# Altium project AlarmClock.PrjPcb
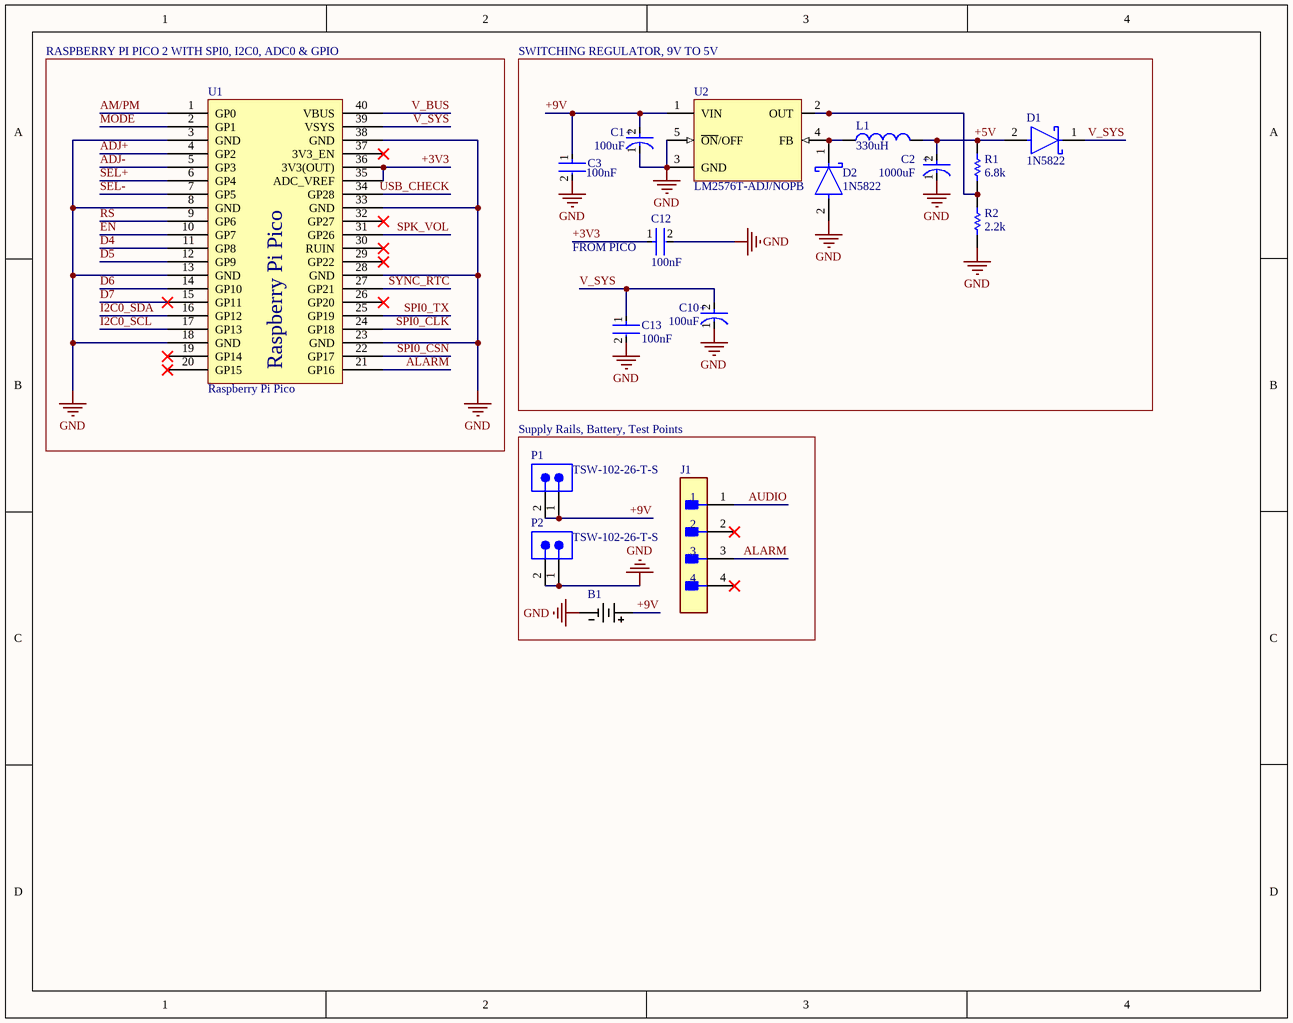
[diagram p0: Core.SchDoc]
3 sheets, 55 parts. Net scope: global (net labels, ports and power ports of the same name join across sheets).
Board file: AlarmClock.PcbDoc
Sheets:
  Core.SchDoc
  Control & Inputs.SchDoc
  Peripherals.SchDoc

## Sheet Core.SchDoc
size A; SheetNumber: 1; SheetTotal: 3

### Parts
B1  BC9VPC  [BC9VPC_MPD]  (value not drawn)
C1  Capacitance: 100uF  [FP-RAD-TH-D_6_3_0_5-L_11-MFG]  (hidden comment: EEUFM1E101B)
C2  value 1000uF  [FP-RAD-TH-D_12_5_0_5-L_20-MFG]  (hidden comment: EEUFP1V102B)
C3  Capacitance: 100nF  [FP-RDE3M1-MFG]  (hidden comment: RDED72W104K3K1H03B)
C10  Capacitance: 100uF  [FP-RAD-TH-D_6_3_0_5-L_11-MFG]  (hidden comment: EEUFM1E101B)
C12  Capacitance: 100nF  [FP-RDE3M1-MFG]  (hidden comment: RDED72W104K3K1H03B)
C13  Capacitance: 100nF  [FP-RDE3M1-MFG]  (hidden comment: RDED72W104K3K1H03B)
D1  1N5822  [FP-DO-201AD-MFG]
D2  1N5822  [FP-DO-201AD-MFG]
J1  TSW-104-23-T-S  [FP-TSW-104-23-T-S-MFG]  (value not drawn)
L1  value 330uH  [SPD73R-334M]  (hidden comment: Inductor)
P1  TSW-102-26-T-S  [SMTC-TSW-102-26-XX-S]
P2  TSW-102-26-T-S  [SMTC-TSW-102-26-XX-S]
R1  Resistance: 6.8k  [RESA60-630X240]  (hidden comment: MFR-25FBF52-1M)
R2  Resistance: 2.2k  [RESA60-630X240]  (hidden comment: MFR-25FBF52-1M)
U1  Raspberry Pi Pico  [Raspberry Pi Pico]
U2  LM2576T-ADJ/NOPB  [KC0005A]

### Blocks framed on the sheet
RASPBERRY PI PICO 2 WITH SPI0, I2C0, ADC0 & GPIO: U1
Supply Rails, Battery, Test Points: B1 J1 P1 P2

### Nets
+3V3: C12.1 U1.35(ADC_VREF) U1.36(3V3(OUT))
+5V: C2.2(A) D1.2(A) L1.2 R1.2
GND: B1.2 C1.1(C) C2.1(C) C3.2 C10.1(C) C12.2 C13.2 D2.2(A) P2.1 P2.2 R2.1 U1.3(GND) U1.8(GND) U1.13(GND) U1.18(GND) U1.23(GND) U1.28(GND) U1.33(GND) U1.38(GND) U2.3(GND) U2.5(~{ON}/OFF)
+9V: B1.1 C1.2(A) C3.1 P1.1 P1.2 U2.1(VIN)
ADJ+: U1.4(GP2)
ADJ-: U1.5(GP3)
ALARM: J1.3 U1.21(GP16)
AM/PM: U1.1(GP0)
AUDIO: J1.1
D4: U1.11(GP8)
D5: U1.12(GP9)
D6: U1.14(GP10)
D7: U1.15(GP11)
EN: U1.10(GP7)
I2C0_SCL: U1.17(GP13)
I2C0_SDA: U1.16(GP12)
MODE: U1.2(GP1)
RS: U1.9(GP6)
SEL+: U1.6(GP4)
SEL-: U1.7(GP5)
SPI0_CLK: U1.24(GP18)
SPI0_CSN: U1.22(GP17)
SPI0_TX: U1.25(GP19)
SPK_VOL: U1.31(GP26)
SYNC_RTC: U1.27(GP21)
USB_CHECK: U1.34(GP28)
V_BUS: U1.40(VBUS)
V_SYS: C10.2(A) C13.1 D1.1(C) U1.39(VSYS)
NetD2_1: D2.1(C) L1.1 U2.4(FB)
NetR1_1: R1.1 R2.2 U2.2(OUT)

Not connected (* = marked no-connect by the designer): J1 2* 4*; U1 19(GP14)* 20(GP15)* 26(GP20)* 29(GP22)* 30(RUIN)* 32(GP27)* 37(3V3_EN)*

### Notes on the sheet
- SWITCHING REGULATOR, 9V TO 5V
- (near C12) FROM PICO
- (in symbol CMP-05427-000856-1) +
- (in symbol CMP-05427-001378-1) +

### Library data of the parts
B1 = BC9VPC: Description; Manufacturer_Name: Memory Protection Devices; Copyright: Copyright (C) 2026 Ultra Librarian. All rights reserved.; Manufacturer_Part_Number: BC9VPC
C1 C10 = CMP-05427-000856-1: Aluminum Electrolytic Capacitors (Radial Lead Type) 100uF ±20% 25V; Lead Diameter: 0.5mm; Polarity: Polar; Ripple Current: 455mA; Impedance: 130mR; Life (Hours): 2000Hour; Length: 11mm; Min Operating Temperature: -40°C; Termination: Radial; Diameter: 6mm; Lead Pitch: 5mm; Tolerance: 20%; Case/Package: Radial; Voltage Rating (DC): 25V; Height - Seated (Max): 0.5inch; RoHS Compliant: Yes; Series: FM; Package Quantity: 2000; Voltage Rating: 25V; Max Operating Temperature: 105°C; Mount: Through Hole; ESR (Equivalent Series Resistance): 130mR; Packaging: Tape and Reel
C2 = CMP-05427-001378-1: Aluminum Electrolytic Capacitors (Radial Lead Type) AEC-Q200 Qualified 1000uF ±20% 35V; RoHS Compliant: Yes
C3 C12 C13 = CMP-06035-016817-1: Ceramic Capacitor 100nF ±10% 450V X7T Radial; Tolerance: 10%; Voltage Rating: 450V; Lead Pitch: 5mm; Max Operating Temperature: 125°C; Voltage Rating (DC): 450V; Case/Package: Radial; Dielectric: X7T; Min Operating Temperature: -55°C; REACH SVHC: No SVHC
D1 D2 = CMP-12187-000025-1: DIODE SCHOTTKY 40V 3A DO201AD; Manufacturer: STMicroelectronics; Max Junction Temp: +150°C; Peak Reverse Current: 2mA; Max Surge Forward Current: 80A; Temperature Range High: +150°C; Automotive: No; RoHS: TRUE; ComponentLink2Description: Datasheet; Manufacturer Part Number: 1N5822; Lead Free: Yes; Octopart: https://octopart.com/1n5822-stmicroelectronics-323225; Device Class L2: Diodes; Max Repetitive Reverse Voltage: 40V; Temperature: to +150°C; Height: 5.3mm; Category: Diode; Digikey Description: DIODE SCHOTTKY 40V 3A DO201AD; ComponentLink2URL: https://www.st.com/resource/en/datasheet/1n5822.pdf; Device Class L3: Schottky Diodes; Device Class L1: Discrete Semiconductors; Forward Current: 3A; Mouser Description: Schottky Diodes & Rectifiers Vr/40V Io/3A BULK; Package: DO-201AD
J1 = CMP-02766-001388-1: CONN HEADER VERT 4POS 2.54MM; Number of Contacts: 4; Gender: Male; Connector Type: Male Pin; Max Voltage Rating (AC): 550V; Max Current Rating: 7.6A; Radiation Hardening: No; Lead Free: Lead Free; RoHS Compliant: Yes; Contact Material: Bronze; Number of Positions: 4; Housing Color: Black; Min Operating Temperature: -55°C; Mount: Through Hole; Number of Rows: 1; Orientation: Straight; Contact Mating Length: 0.23inch; Contact Type: Male Pin; REACH SVHC: No SVHC; Max Operating Temperature: 105°C; Color: Black; Pitch: 2.54mm; Length: 10.16mm; Series: TSW; Packaging: Bulk; Contact Plating: Tin; Package Quantity: 1; Termination: Solder; Housing Material: Polyester; Width: 2.54mm; Depth: 2.54mm
L1 = Inductor: Code_IEC: 1005; Published: 8-Jun-2000; LatestRevisionDate: 29-May-2009; LatestRevisionNote: IPC-7351 Footprint Added.; PackageReference: 0402-A; Publisher: Altium Limited; PackageDescription: Chip Inductor; Code_JEITA: 0402
P1 P2 = CMP-1024-00328-1: 0.025" SQ Post Header, Through-hole, Vertical, -55 to 105 degC, 2.54 mm Pitch, 2-Pin, Male, RoHS; Manufacturer: Samtec; Pitch: 2.54 mm; PackageReference: TSW-102-26-XX-S; ComponentLink1URL: http://www.samtec.com; ComponentLink3Description: Package Specification; ComponentLink3URL: http://www.samtec.com/documents/webfiles/cpdf/TSW-XXX-XX-XXX-X-XX-XXX-MKT.pdf; DatasheetVersion: F-214; ComponentLink2URL: http://www.samtec.com/documents/webfiles/pdf/TSW_TH.PDF; Mounting Technology: Through-hole; ComponentLink2Description: Datasheet; PartNumber: TSW-102-26-T-S; ComponentLink1Description: Manufacturer URL; PackageDescription: .025[0.64] SQ. Post Terminal Strip Assembly; Orientation: Vertical; PackageVersion: DM, 8/1988; Temperature Range: -55 to 105 degC; RoHS: True
R1 R2 = CMP-1659-00070-1: Axial Resistor, 1 MOhm, +/- 1%, 250 mW, -55 to 155 degC, 2-Pin THD, RoHS, Bulk; Power Rating: 250 mW; Voltage Rating: 250 V; ComponentLink1Description: Manufacturer URL; PackageReference: MFR-25; ComponentLink2Description: Datasheet; ComponentLink2URL: http://www.yageo.com/documents/recent/Yageo%20LR_MFR_2013.pdf; Tolerance: 1%; DatasheetVersion: Apr-13; Package Quantity: 200; Packaging: Bulk; Case\Package: Axial; RoHSCompliant: true; ComponentLink1URL: http://www.yageo.com/; Length: 0.248 inch; Min Operating Temperature: -55 degC; Mount: Through Hole; PackageDescription: 2-Pin Axial Lead, Dia 2.4 mm, Body Length 6.3 mm; Max Operating Temperature: 155 degC
U2 = CMP-0069-02005-3: SIMPLE SWITCHER® 3A Step-Down Voltage Regulator, 5-pin TO-220, Pb-Free; Manufacturer: Texas Instruments; PowerWise: N; PackageTopMarking: NSUZXYTTE#*LM2576T*-ADJ P+; CompType: Switcher; PinCount: 5; PackageReference: KC0005A; RoHS: Y; Code_JEDEC: TO-220-AB; ComponentLink1URL: http://www.ti.com/general/docs/lit/getliterature.tsp?genericPartNumber=LM2576&fileType=pdf; ComponentLink1Description: Datasheet URL; PackageDescription: TO-220, Molded, 5 Lead, Straight

## Sheet Control & Inputs.SchDoc
size A; SheetNumber: 2; SheetTotal: 3
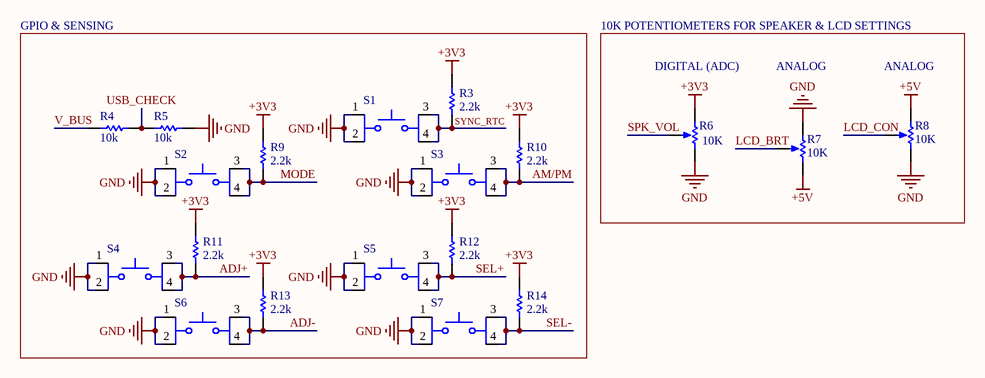
[diagram p1: Control & Inputs.SchDoc]

### Parts
R3  Resistance: 2.2k  [RESA60-630X240]  (hidden comment: MFR-25FBF52-1M)
R4  Resistance: 10k  [RESA60-630X240]  (hidden comment: MFR-25FBF52-1M)
R5  Resistance: 10k  [RESA60-630X240]  (hidden comment: MFR-25FBF52-1M)
R6  value 10K  [POT OFFSET 200]  (hidden comment: RPot_3)
R7  value 10K  [POT OFFSET 200]  (hidden comment: RPot_3)
R8  value 10K  [POT OFFSET 200]  (hidden comment: RPot_3)
R9  Resistance: 2.2k  [RESA60-630X240]  (hidden comment: MFR-25FBF52-1M)
R10  Resistance: 2.2k  [RESA60-630X240]  (hidden comment: MFR-25FBF52-1M)
R11  Resistance: 2.2k  [RESA60-630X240]  (hidden comment: MFR-25FBF52-1M)
R12  Resistance: 2.2k  [RESA60-630X240]  (hidden comment: MFR-25FBF52-1M)
R13  Resistance: 2.2k  [RESA60-630X240]  (hidden comment: MFR-25FBF52-1M)
R14  Resistance: 2.2k  [RESA60-630X240]  (hidden comment: MFR-25FBF52-1M)
S1  TL1105AF160Q  [SW_TL1105AF160Q]  (value not drawn)
S2  TL1105AF160Q  [SW_TL1105AF160Q]  (value not drawn)
S3  TL1105AF160Q  [SW_TL1105AF160Q]  (value not drawn)
S4  TL1105AF160Q  [SW_TL1105AF160Q]  (value not drawn)
S5  TL1105AF160Q  [SW_TL1105AF160Q]  (value not drawn)
S6  TL1105AF160Q  [SW_TL1105AF160Q]  (value not drawn)
S7  TL1105AF160Q  [SW_TL1105AF160Q]  (value not drawn)

### Blocks framed on the sheet
GPIO & SENSING: R3-R5 R9-R14 S1-S7

### Nets
+3V3: R3.2 R6.1(TOP) R9.2 R10.2 R11.2 R12.2 R13.2 R14.2
+5V: R7.3(BOT) R8.1(TOP)
GND: R5.2 R6.3(BOT) R7.1(TOP) R8.3(BOT) S1.1 S1.2 S2.1 S2.2 S3.1 S3.2 S4.1 S4.2 S5.1 S5.2 S6.1 S6.2 S7.1 S7.2
ADJ+: R11.1 S4.3 S4.4
ADJ-: R13.1 S6.3 S6.4
AM/PM: R10.1 S3.3 S3.4
LCD_BRT: R7.2(TAP)
LCD_CON: R8.2(TAP)
MODE: R9.1 S2.3 S2.4
SEL+: R12.1 S5.3 S5.4
SEL-: R14.1 S7.3 S7.4
SPK_VOL: R6.2(TAP)
SYNC_RTC: R3.1 S1.3 S1.4
USB_CHECK: R4.2 R5.1
V_BUS: R4.1

### Notes on the sheet
- 10K POTENTIOMETERS FOR SPEAKER & LCD SETTINGS
- (near R6) DIGITAL (ADC)
- ANALOG
- (near R8) ANALOG

### Library data of the parts
R3-R5 R9-R14 = CMP-1659-00070-1: as R1 on sheet Core; ComponentLink1Description: Manufacturer URL; PackageReference: MFR-25; ComponentLink2Description: Datasheet; ComponentLink2URL: http://www.yageo.com/documents/recent/Yageo%20LR_MFR_2013.pdf; Tolerance: 1%; DatasheetVersion: Apr-13; Package Quantity: 200; Packaging: Bulk; Case\Package: Axial; RoHSCompliant: true; ComponentLink1URL: http://www.yageo.com/; Length: 0.248 inch; Min Operating Temperature: -55 degC; Mount: Through Hole; PackageDescription: 2-Pin Axial Lead, Dia 2.4 mm, Body Length 6.3 mm; Max Operating Temperature: 155 degC
R6-R8 = RPot: Potentiometer; Sim Note: Enter the Resistance value and the set point into parameter fields.; Set Position: 0.5; Published: 8-Jun-2000; LatestRevisionDate: 17-Jul-2002; LatestRevisionNote: Re-released for DXP Platform.; Publisher: Altium Limited
S1-S7 = TL1105AF160Q: Tactile Switch SPST-NO Top Actuated Through Hole; MF: E-Switch; SnapEDA_Link: https://www.snapeda.com/parts/TL1105AF160Q/E-Switch/view-part/?ref=snap; Package: None; Value: *; MP: TL1105AF160Q; Check_prices: https://www.snapeda.com/parts/TL1105AF160Q/E-Switch/view-part/?ref=eda

## Sheet Peripherals.SchDoc
size A; SheetNumber: 3; SheetTotal: 3
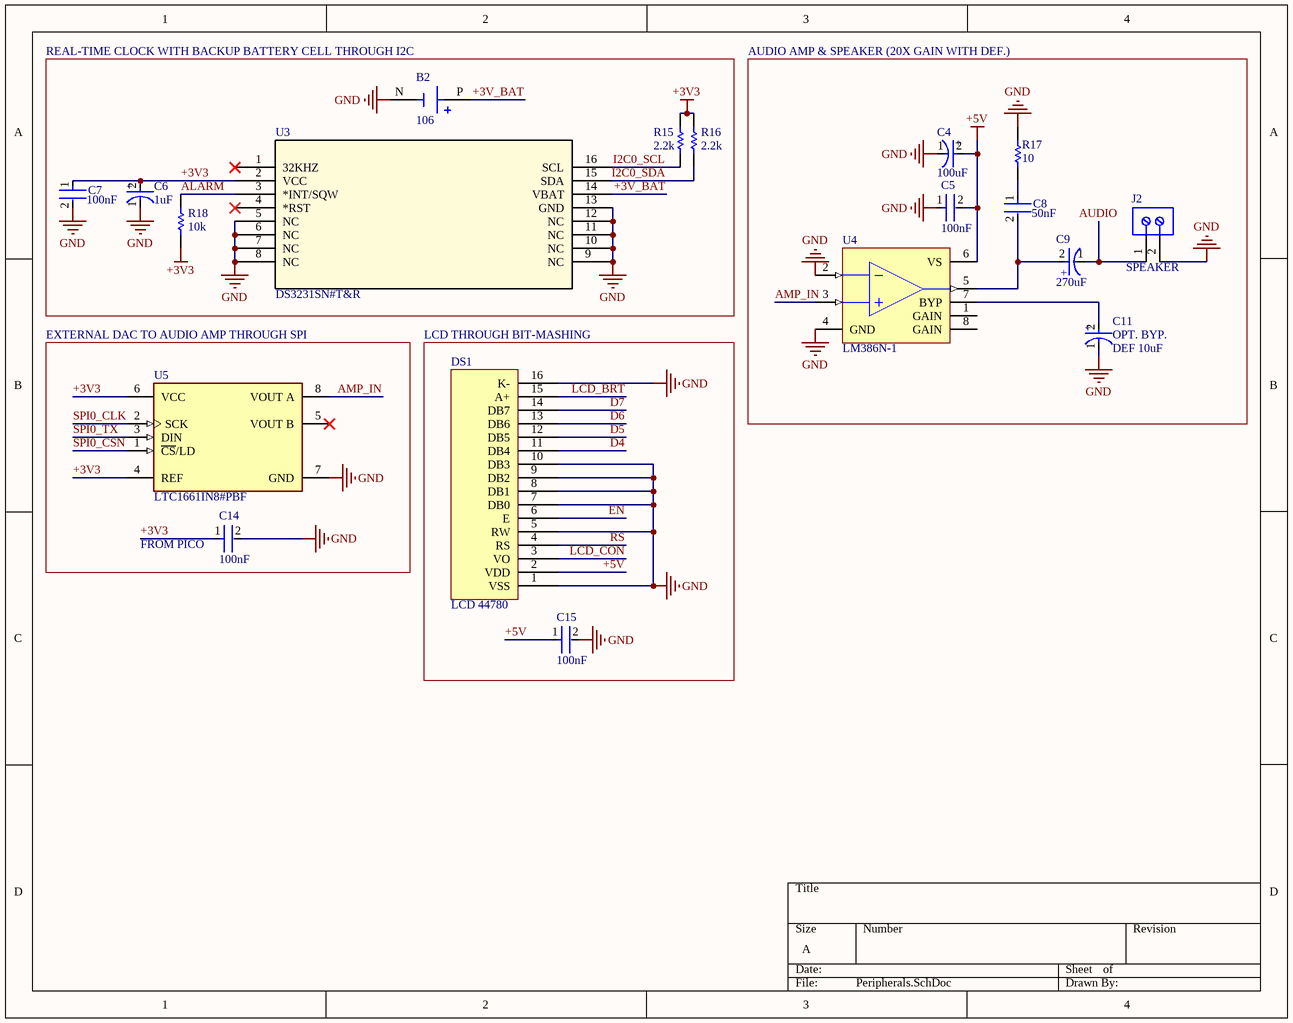
[diagram p2: Peripherals.SchDoc]

### Parts
B2  106  [BAT_106]
C4  Capacitance: 100uF  [FP-RAD-TH-D_6_3_0_5-L_11-MFG]  (hidden comment: EEUFM1E101B)
C5  Capacitance: 100nF  [FP-RDE3M1-MFG]  (hidden comment: RDED72W104K3K1H03B)
C6  Capacitance: 1uF  [FP-RAD-TH-D_6_3_0_5-L_11-MFG]  (hidden comment: EEUFM1E101B)
C7  Capacitance: 100nF  [FP-RDE3M1-MFG]  (hidden comment: RDED72W104K3K1H03B)
C8  Capacitance: 50nF  [FP-RDE3M1-MFG]  (hidden comment: RDED72W104K3K1H03B)
C9  Capacitor: 270uF  [FP-RAD-TH-D_12_5_0_5-L_20-MFG]  (hidden comment: EEUFS1K271B)
C11  Capacitance: OPT. BYP.  [FP-RAD-TH-D_6_3_0_5-L_11-MFG]  (hidden comment: EEUFM1E101B)
C14  Capacitance: 100nF  [FP-RDE3M1-MFG]  (hidden comment: RDED72W104K3K1H03B)
C15  Capacitance: 100nF  [FP-RDE3M1-MFG]  (hidden comment: RDED72W104K3K1H03B)
DS1  LCD 44780  [OLED 16x2]
J2  1714955  [PHOE-1714955_V]  (value not drawn)
R15  Resistance: 2.2k  [RESA60-630X240]  (hidden comment: MFR-25FBF52-1M)
R16  Resistance: 2.2k  [RESA60-630X240]  (hidden comment: MFR-25FBF52-1M)
R17  Resistance: 10  [RESA60-630X240]  (hidden comment: MFR-25FBF52-1M)
R18  Resistance: 10k  [RESA60-630X240]  (hidden comment: MFR-25FBF52-1M)
U3  DS3231SN#T&R  [21-0042B_16_MXM]
U4  LM386N-1  [DIP-8]
U5  LTC1661IN8#PBF  [FP-N-8-05-08-1510-MFG]

### Blocks framed on the sheet
REAL-TIME CLOCK WITH BACKUP BATTERY CELL THROUGH I2C: B2 C6 C7 R15 R16 R18 U3
LCD THROUGH BIT-MASHING: C15 DS1

### Nets
+3V3: C6.2(A) C7.1 C14.1 R15.2 R16.2 R18.1 U3.2(VCC) U5.4(REF) U5.6(VCC)
+5V: C4.2(A) C5.2 C15.1 DS1.2(VDD) U4.6(VS)
GND: B2.N(NEG) C4.1(C) C5.1 C6.1(C) C7.2 C11.1(C) C14.2 C15.2 DS1.1(VSS) DS1.5(RW) DS1.7(DB0) DS1.8(DB1) DS1.9(DB2) DS1.10(DB3) DS1.16(K-) J2.2 R17.1 U3.5(NC) U3.6(NC) U3.7(NC) U3.8(NC) U3.9(NC) U3.10(NC) U3.11(NC) U3.12(NC) U3.13(GND) U4.2(IN-) U4.4(GND) U5.7(GND)
+3V_BAT: B2.P(POS) U3.14(VBAT)
ALARM: R18.2 U3.3(*INT/SQW)
AMP_IN: U4.3(IN+) U5.8(VOUT_A)
AUDIO: C9.1(C) J2.1
D4: DS1.11(DB4)
D5: DS1.12(DB5)
D6: DS1.13(DB6)
D7: DS1.14(DB7)
EN: DS1.6(E)
I2C0_SCL: R15.1 U3.16(SCL)
I2C0_SDA: R16.1 U3.15(SDA)
LCD_BRT: DS1.15(A+)
LCD_CON: DS1.3(VO)
RS: DS1.4(RS)
SPI0_CLK: U5.2(SCK)
SPI0_CSN: U5.1(~{CS}/LD)
SPI0_TX: U5.3(DIN)
NetC8_1: C8.1 R17.2
NetC8_2: C8.2 C9.2(A) U4.5(OUT)
NetC11_2: C11.2(A) U4.7(BYP)

Not connected (* = marked no-connect by the designer): U3 1(32KHZ)* 4(*RST)*; U4 1(GAIN) 8(GAIN); U5 5(VOUT_B)*

### Notes on the sheet
- AUDIO AMP & SPEAKER (20X GAIN WITH DEF.)
- (near J2) SPEAKER
- EXTERNAL DAC TO AUDIO AMP THROUGH SPI
- (near C11) DEF 10uF
- (near C14) FROM PICO
- (in symbol CMP-05427-000433-1) +
- (in symbol CMP-05427-000856-1) +

### Library data of the parts
B2 = 106: Battery Holder, Heavy Duty, THM, Plastic, 1 Cell, 20mm | Keystone Electronics 106; SnapEDA_Link: https://www.snapeda.com/parts/106/Keystone/view-part/?ref=snap; Package: None; Value: *; MF: Keystone Electronics; MP: 106; Check_prices: https://www.snapeda.com/parts/106/Keystone/view-part/?ref=eda
C4 C6 C11 = CMP-05427-000856-1: as C1 on sheet Core; Length: 11mm; Min Operating Temperature: -40°C; Termination: Radial; Diameter: 6mm; Lead Pitch: 5mm; Tolerance: 20%; Case/Package: Radial; Voltage Rating (DC): 25V; Height - Seated (Max): 0.5inch; RoHS Compliant: Yes; Series: FM; Package Quantity: 2000; Voltage Rating: 25V; Max Operating Temperature: 105°C; Mount: Through Hole; ESR (Equivalent Series Resistance): 130mR; Packaging: Tape and Reel
C5 C7 C8 C14 C15 = CMP-06035-016817-1: as C3 on sheet Core; Tolerance: 10%; Voltage Rating: 450V; Lead Pitch: 5mm; Max Operating Temperature: 125°C; Voltage Rating (DC): 450V; Case/Package: Radial; Dielectric: X7T; Min Operating Temperature: -55°C; REACH SVHC: No SVHC
C9 = CMP-05427-000433-1: Aluminum Electrolytic Capacitors (Radial Lead Type) 270uF ±20% 80V; RoHS Compliant: Yes
J2 = CMP-2000-05797-1: PC Terminal Block, Pitch 6.35 mm, 1 x 2 Position, Height 21.5 mm, Tail Lenght 5.1 mm, RoHS, Bulk; Manufacturer: Phoenix Contact; Package Description: PC Terminal Block, Pitch 6.35 mm, 1 x 2 Position, Height 21.5 mm, Tail Lenght 5.1 mm; Datasheet URL: http://media.digikey.com/pdf/Data%20Sheets/Phoenix%20Contact%20PDFs/1714955.pdf; Package Reference: 1714955; Manufacturer URL: http://www.phoenixcontact.com/; Datasheet Version: 02/2010; Mounting Technology: ThroughHole
R15-R18 = CMP-1659-00070-1: as R1 on sheet Core; ComponentLink1Description: Manufacturer URL; PackageReference: MFR-25; ComponentLink2Description: Datasheet; ComponentLink2URL: http://www.yageo.com/documents/recent/Yageo%20LR_MFR_2013.pdf; Tolerance: 1%; DatasheetVersion: Apr-13; Package Quantity: 200; Packaging: Bulk; Case\Package: Axial; RoHSCompliant: true; ComponentLink1URL: http://www.yageo.com/; Length: 0.248 inch; Min Operating Temperature: -55 degC; Mount: Through Hole; PackageDescription: 2-Pin Axial Lead, Dia 2.4 mm, Body Length 6.3 mm; Max Operating Temperature: 155 degC
U3 = DS3231SNTR: Extremely Accurate IÂ²C-Integrated RTC/TCXO/Crystal; Manufacturer_Name: Analog Devices Inc; Copyright: Copyright (C) 2025 Ultra Librarian. All rights reserved.; Manufacturer_Part_Number: DS3231SN#T&R; RefDes: RefDes; Type: Type
U4 = LM386N-1: Low-Voltage Audio Power Amplifier; Published: 15-Apr-2002; DatasheetDocument: Sep-1997; PackageDocument: Sep-1997; PackageReference: N08E; Publisher: Altium Limited
U5 = CMP-00026-88317689-1: LTC1661IN8#PBF Dual Serial Input Loading 30 Us Settling Time 10-BIT Dac PDIP8; Manufacturer Lifecycle Status: PRODUCTION; Min Supply Voltage: 2.7V; Resolution: 1.25B; Number of Bits: 10; Output Type: Voltage; Max Supply Voltage: 5.5V; Integral Nonlinearity (INL): 2LSB; Supply Type: Single; Settling Time: 30µs; Number of Converters: 2; Case/Package: DIP; Lifecycle Status: Production; NexarPartId: 88317689; Number of Pins: 8; RoHS: Compliant; Min Operating Temperature: -40°C; Max Operating Temperature: 85°C; Interface: Serial; Lead Free: Lead Free; Mount: Through Hole; Number of Channels: 2

## Nets that join several sheets
+3V3: Core (C12.1 U1.35 U1.36), Control & Inputs (8 pins), Peripherals (9 pins)
+5V: Core (C2.2 D1.2 L1.2 R1.2), Control & Inputs (R7.3 R8.1), Peripherals (5 pins)
GND: Core (21 pins), Control & Inputs (18 pins), Peripherals (29 pins)
ADJ+: Core (U1.4), Control & Inputs (R11.1 S4.3 S4.4)
ADJ-: Core (U1.5), Control & Inputs (R13.1 S6.3 S6.4)
ALARM: Core (J1.3 U1.21), Peripherals (R18.2 U3.3)
AM/PM: Core (U1.1), Control & Inputs (R10.1 S3.3 S3.4)
AUDIO: Core (J1.1), Peripherals (C9.1 J2.1)
D4: Core (U1.11), Peripherals (DS1.11)
D5: Core (U1.12), Peripherals (DS1.12)
D6: Core (U1.14), Peripherals (DS1.13)
D7: Core (U1.15), Peripherals (DS1.14)
EN: Core (U1.10), Peripherals (DS1.6)
I2C0_SCL: Core (U1.17), Peripherals (R15.1 U3.16)
I2C0_SDA: Core (U1.16), Peripherals (R16.1 U3.15)
LCD_BRT: Control & Inputs (R7.2), Peripherals (DS1.15)
LCD_CON: Control & Inputs (R8.2), Peripherals (DS1.3)
MODE: Core (U1.2), Control & Inputs (R9.1 S2.3 S2.4)
RS: Core (U1.9), Peripherals (DS1.4)
SEL+: Core (U1.6), Control & Inputs (R12.1 S5.3 S5.4)
SEL-: Core (U1.7), Control & Inputs (R14.1 S7.3 S7.4)
SPI0_CLK: Core (U1.24), Peripherals (U5.2)
SPI0_CSN: Core (U1.22), Peripherals (U5.1)
SPI0_TX: Core (U1.25), Peripherals (U5.3)
SPK_VOL: Core (U1.31), Control & Inputs (R6.2)
SYNC_RTC: Core (U1.27), Control & Inputs (R3.1 S1.3 S1.4)
USB_CHECK: Core (U1.34), Control & Inputs (R4.2 R5.1)
V_BUS: Core (U1.40), Control & Inputs (R4.1)